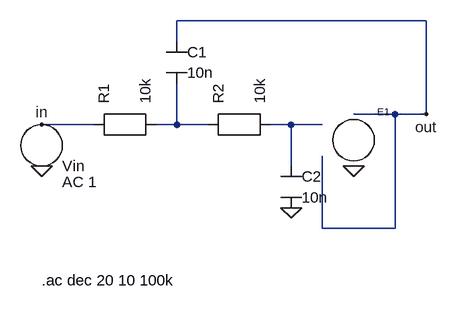
[diagram p0: schematic sallen_key_drawn.asc]
sallen_key_drawn.asc, the LTspice schematic file:
Version 4
SHEET 1 880 680
WIRE 96 256 176 256
WIRE 272 256 352 256
WIRE 448 256 528 256
WIRE 304 192 304 256
WIRE 480 320 480 256
WIRE 304 128 304 96
WIRE 304 96 688 96
WIRE 688 96 688 240
WIRE 688 240 576 240
WIRE 528 304 528 416
WIRE 528 416 640 416
WIRE 640 416 640 240
FLAG 688 240 out
FLAG 96 256 in
FLAG 96 320 0
FLAG 480 384 0
FLAG 576 320 0
SYMBOL voltage 96 288 R0
SYMATTR InstName Vin
SYMATTR Value AC 1
SYMBOL res 224 256 R270
SYMATTR InstName R1
SYMATTR Value 10k
SYMBOL res 400 256 R270
SYMATTR InstName R2
SYMATTR Value 10k
SYMBOL e 576 224 R0
SYMATTR InstName E1
SYMATTR Value 1e5
SYMBOL cap 304 160 R0
SYMATTR InstName C1
SYMATTR Value 10n
SYMBOL cap 480 352 R0
SYMATTR InstName C2
SYMATTR Value 10n
TEXT 96 496 Left 2 !.ac dec 20 10 100k

The netlist it stands for:
* sallen_key_drawn.asc
Vin in 0 AC 1
R1 in N001 10k
R2 N001 N002 10k
E1 out 0 N002 out 1e5
C1 out N001 10n
C2 N002 0 10n
.ac dec 20 10 100k
.backanno
.end